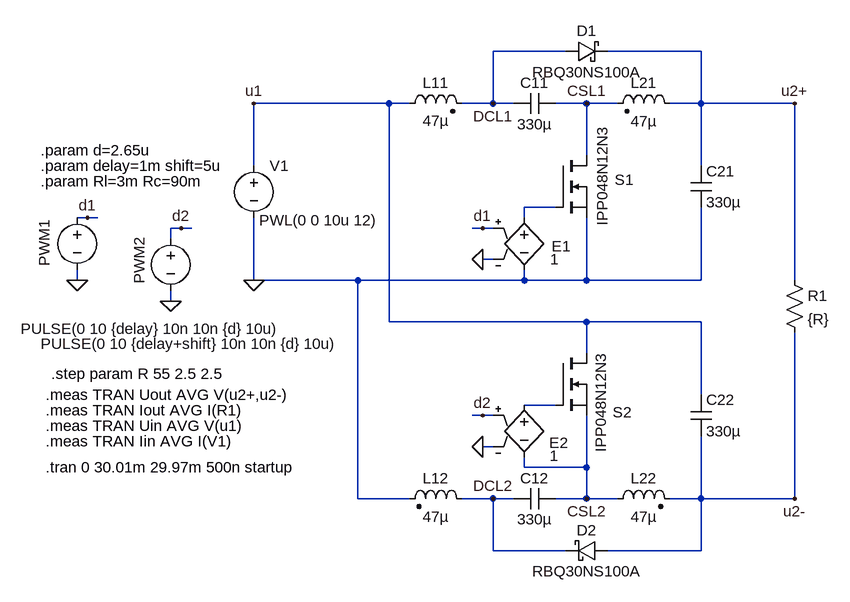
[diagram p0: schematic BC_Type4_nonideal_ccm_wirkungsgrad_12_24.asc]
BC_Type4_nonideal_ccm_wirkungsgrad_12_24.asc, the LTspice schematic file:
Version 4
SHEET 1 1540 1056
WIRE 416 80 304 80
WIRE 624 80 480 80
WIRE 144 160 -64 160
WIRE 176 160 144 160
WIRE 304 160 304 80
WIRE 304 160 256 160
WIRE 336 160 304 160
WIRE 448 160 400 160
WIRE 496 160 448 160
WIRE 624 160 624 80
WIRE 624 160 576 160
WIRE 768 160 624 160
WIRE 448 240 448 160
WIRE -64 256 -64 160
WIRE 624 256 624 160
WIRE 400 320 352 320
WIRE -320 336 -336 336
WIRE -304 336 -320 336
WIRE 352 336 352 320
WIRE -176 352 -192 352
WIRE -160 352 -176 352
WIRE 288 352 272 352
WIRE 304 352 288 352
WIRE -192 368 -192 352
WIRE 304 400 288 400
WIRE -336 432 -336 416
WIRE -64 432 -64 336
WIRE 96 432 -64 432
WIRE 352 432 352 416
WIRE 352 432 96 432
WIRE 448 432 448 336
WIRE 448 432 352 432
WIRE 624 432 624 320
WIRE 624 432 448 432
WIRE 768 432 768 160
WIRE -192 464 -192 448
WIRE 144 496 144 160
WIRE 448 496 144 496
WIRE 624 496 448 496
WIRE 448 544 448 496
WIRE 624 608 624 496
WIRE 400 624 352 624
WIRE 288 640 272 640
WIRE 304 640 288 640
WIRE 304 688 288 688
WIRE 352 720 352 704
WIRE 448 720 448 640
WIRE 448 720 352 720
WIRE 96 768 96 432
WIRE 176 768 96 768
WIRE 304 768 256 768
WIRE 336 768 304 768
WIRE 448 768 448 720
WIRE 448 768 400 768
WIRE 496 768 448 768
WIRE 624 768 624 672
WIRE 624 768 576 768
WIRE 768 768 768 512
WIRE 768 768 624 768
WIRE 304 848 304 768
WIRE 416 848 304 848
WIRE 624 848 624 768
WIRE 624 848 480 848
FLAG -64 432 0
FLAG -336 432 0
FLAG -192 464 0
FLAG -320 336 d1
FLAG -176 352 d2
FLAG 288 400 0
FLAG 288 352 d1
FLAG 288 688 0
FLAG 288 640 d2
FLAG 768 160 u2+
FLAG 768 768 u2-
FLAG -64 160 u1
FLAG 304 160 DCL1
FLAG 304 768 DCL2
FLAG 448 768 CSL2
FLAG 448 160 CSL1
SYMBOL cap 400 144 R90
WINDOW 0 0 32 VBottom 2
WINDOW 3 32 32 VTop 2
SYMATTR InstName C11
SYMATTR Value 330µ
SYMATTR SpiceLine Rser={Rc}
SYMBOL ind2 592 176 M270
WINDOW 0 32 56 VTop 2
WINDOW 3 4 56 VBottom 2
SYMATTR InstName L21
SYMATTR Value 47µ
SYMATTR Type ind
SYMATTR SpiceLine Rser={Rl}
SYMBOL ind2 160 176 R270
WINDOW 0 32 56 VTop 2
WINDOW 3 5 56 VBottom 2
SYMATTR InstName L11
SYMATTR Value 47µ
SYMATTR Type ind
SYMATTR SpiceLine Rser={Rl}
SYMBOL cap 608 256 R0
SYMATTR InstName C21
SYMATTR Value 330µ
SYMATTR SpiceLine Rser={Rc}
SYMBOL cap 336 752 M90
WINDOW 0 0 32 VBottom 2
WINDOW 3 32 32 VTop 2
SYMATTR InstName C12
SYMATTR Value 330µ
SYMATTR SpiceLine Rser={Rc}
SYMBOL ind2 480 784 R270
WINDOW 0 32 56 VTop 2
WINDOW 3 4 56 VBottom 2
SYMATTR InstName L22
SYMATTR Value 47µ
SYMATTR Type ind
SYMATTR SpiceLine Rser={Rl}
SYMBOL ind2 272 784 M270
WINDOW 0 32 56 VTop 2
WINDOW 3 4 56 VBottom 2
SYMATTR InstName L12
SYMATTR Value 47µ
SYMATTR Type ind
SYMATTR SpiceLine Rser={Rl}
SYMBOL cap 608 608 R0
SYMATTR InstName C22
SYMATTR Value 330µ
SYMATTR SpiceLine Rser={Rc}
SYMBOL voltage -64 240 R0
WINDOW 123 0 0 Left 0
WINDOW 39 0 0 Left 0
WINDOW 3 8 100 Left 2
SYMATTR Value PWL(0 0 10u 12)
SYMATTR InstName V1
SYMBOL res 752 416 R0
SYMATTR InstName R1
SYMATTR Value {R}
SYMBOL nmos 400 240 R0
WINDOW 0 91 37 Left 2
WINDOW 3 72 109 VLeft 2
SYMATTR InstName S1
SYMATTR Value IPP048N12N3
SYMBOL nmos 400 544 R0
WINDOW 0 88 91 Left 2
WINDOW 3 70 153 VLeft 2
SYMATTR InstName S2
SYMATTR Value IPP048N12N3
SYMBOL schottky 480 864 M270
WINDOW 0 32 32 VTop 2
WINDOW 3 0 32 VBottom 2
SYMATTR InstName D2
SYMATTR Value RBQ30NS100A
SYMATTR Description Diode
SYMATTR Type diode
SYMBOL schottky 416 96 R270
WINDOW 0 32 32 VTop 2
WINDOW 3 0 32 VBottom 2
SYMATTR InstName D1
SYMATTR Value RBQ30NS100A
SYMATTR Description Diode
SYMATTR Type diode
SYMBOL voltage -336 320 R0
WINDOW 0 -35 55 VBottom 2
WINDOW 3 114 171 Top 2
WINDOW 123 0 0 Left 0
WINDOW 39 0 0 Left 0
SYMATTR InstName PWM1
SYMATTR Value PULSE(0 10 {delay} 10n 10n {d} 10u)
SYMBOL voltage -192 352 R0
WINDOW 0 -64 50 VTop 2
WINDOW 3 30 193 Bottom 2
WINDOW 123 0 0 Left 0
WINDOW 39 0 0 Left 0
SYMATTR InstName PWM2
SYMATTR Value PULSE(0 10 {delay+shift} 10n 10n {d} 10u)
SYMBOL e 352 320 R0
WINDOW 0 42 60 Left 2
WINDOW 3 40 80 Left 2
SYMATTR InstName E1
SYMATTR Value 1
SYMBOL e 352 608 R0
WINDOW 0 38 74 Left 2
WINDOW 3 39 94 Left 2
SYMATTR InstName E2
SYMATTR Value 1
TEXT -392 280 Left 2 !.param Rl=3m Rc=90m
TEXT -392 232 Left 2 !.param d=2.65u
TEXT -392 256 Left 2 !.param delay=1m shift=5u
TEXT -384 720 Left 2 !.tran 0 30.01m 29.97m 500n startup
TEXT -384 608 Left 2 !.meas TRAN Uout AVG V(u2+,u2-)
TEXT -384 656 Left 2 !.meas TRAN Uin AVG V(u1)
TEXT -376 576 Left 2 !.step param R 55 2.5 2.5
TEXT -384 632 Left 2 !.meas TRAN Iout AVG I(R1)
TEXT -384 680 Left 2 !.meas TRAN Iin AVG I(V1)

The netlist it stands for:
* BC_Type4_nonideal_ccm_wirkungsgrad_12_24.asc
C11 CSL1 DCL1 330µ Rser={Rc}
L21 u2+ CSL1 47µ Rser={Rl}
L11 u1 DCL1 47µ Rser={Rl}
C21 u2+ 0 330µ Rser={Rc}
C12 DCL2 CSL2 330µ Rser={Rc}
L22 CSL2 u2- 47µ Rser={Rl}
L12 DCL2 0 47µ Rser={Rl}
C22 u1 u2- 330µ Rser={Rc}
V1 u1 0 PWL(0 0 10u 12)
R1 u2+ u2- {R}
M§S1 CSL1 N001 0 0 IPP048N12N3
M§S2 u1 N002 CSL2 CSL2 IPP048N12N3
D2 u2- DCL2 RBQ30NS100A
D1 DCL1 u2+ RBQ30NS100A
V§PWM1 d1 0 PULSE(0 10 {delay} 10n 10n {d} 10u)
V§PWM2 d2 0 PULSE(0 10 {delay+shift} 10n 10n {d} 10u)
E1 N001 0 d1 0 1
E2 N002 CSL2 d2 0 1
.model D D
.lib standard.dio
.model NMOS NMOS
.model PMOS PMOS
.lib standard.mos
.param Rl=3m Rc=90m
.param d=2.65u
.param delay=1m shift=5u
.tran 0 30.01m 29.97m 500n startup
.meas TRAN Uout AVG V(u2+,u2-)
.meas TRAN Uin AVG V(u1)
.step param R 55 2.5 2.5
.meas TRAN Iout AVG I(R1)
.meas TRAN Iin AVG I(V1)
.backanno
.end